# Altium schematic sheet MSD_CARD.SchDoc
size A; SheetNumber: 2; SheetTotal: 5
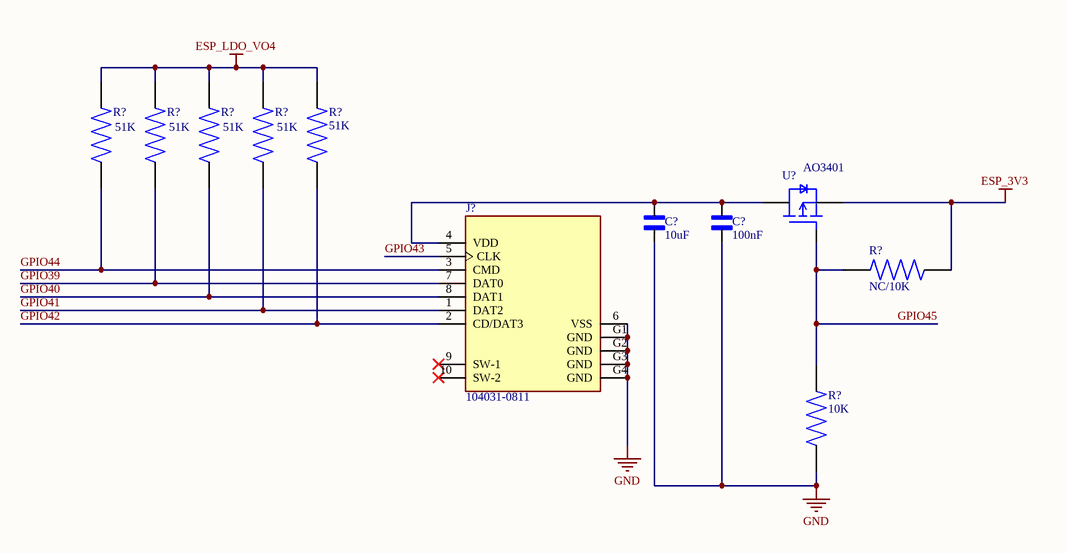
[diagram p0: MSD_CARD.SchDoc]

## Parts
(Parts that share a designator on the sheet are numbered #1, #2 ... from top to bottom, then left to right.)
C?#1  10uF  [CAPC1005X61N]
C?#2  100nF  [CAPC1005X61N]
J?  104031-0811  [MOLEX_104031-0811]
R?#1  51K  [RES_ERJU02F5102X]
R?#2  51K  [RES_ERJU02F5102X]
R?#3  51K  [RES_ERJU02F5102X]
R?#4  51K  [RES_ERJU02F5102X]
R?#5  51K  [RES_ERJU02F5102X]
R?#6  NC/10K  [RES_ERJU02F5102X]
R?#7  10K  [RES_ERJU02F5102X]
U?  AO3401  [SOT23-3]

## Nets
ESP_3V3: R?#6.1 U?.2(S)
ESP_LDO_VO4: R?#1.2 R?#2.2 R?#3.2 R?#4.2 R?#5.2
GND: C?#1.1 C?#2.1 J?.6(VSS) J?.G1(GND) J?.G2(GND) J?.G3(GND) J?.G4(GND) R?#7.1
GPIO39: J?.7(DAT0) R?#2.1
GPIO40: J?.8(DAT1) R?#3.1
GPIO41: J?.1(DAT2) R?#4.1
GPIO42: J?.2(CD/DAT3) R?#5.1
GPIO43: J?.5(CLK)
GPIO44: J?.3(CMD) R?#1.1
GPIO45: R?#6.2 R?#7.2 U?.1(G)
NetC?#1_2: C?#1.2 C?#2.2 J?.4(VDD) U?.3(D)

Not connected (* = marked no-connect by the designer): J? 9(SW-1)* 10(SW-2)*

## Library data of the parts
C?#1 C?#2 = cap_0402_VJ0402D100MXCAP: cap 0402; MF: Vishay Vitramon; SnapEDA_Link: https://www.snapeda.com/parts/VJ0402D100MXCAP/Vishay/view-part/?ref=snap; Package: 1005 Vishay Vitramon; Value: *; MP: VJ0402D100MXCAP; Check_prices: https://www.snapeda.com/parts/VJ0402D100MXCAP/Vishay/view-part/?ref=eda
J? = 104031-0811: Surface Mount Micro SD Card Connector, with Push In Termination | Molex Incorporated 104031-0811; SnapEDA_Link: https://www.snapeda.com/parts/104031-0811/Molex/view-part/?ref=snap; Package: None; Value: *; MF: Molex; MP: 104031-0811; Check_prices: https://www.snapeda.com/parts/104031-0811/Molex/view-part/?ref=eda
R?#1-R?#7 = res_0402_ERJU02F5102X: Availability: Unavailable; MP: ERJU02F5102X; Price: None; Package: None; Value: *
U? = AO3401: P-Channel 30 V 4A (Ta) 1.4W (Ta) Surface Mount SOT-23-3; MF: Alpha & Omega Semiconductor; SnapEDA_Link: https://www.snapeda.com/parts/AO3401/Alpha/view-part/?ref=snap; Package: SOT-23-3 Alpha &amp; Omega Semiconductor; Value: *; MP: AO3401; Check_prices: https://www.snapeda.com/parts/AO3401/Alpha/view-part/?ref=eda